# Altium schematic sheet STPMotorControl_1.SchDoc
size A4; SheetNumber: 2; SheetTotal: 8
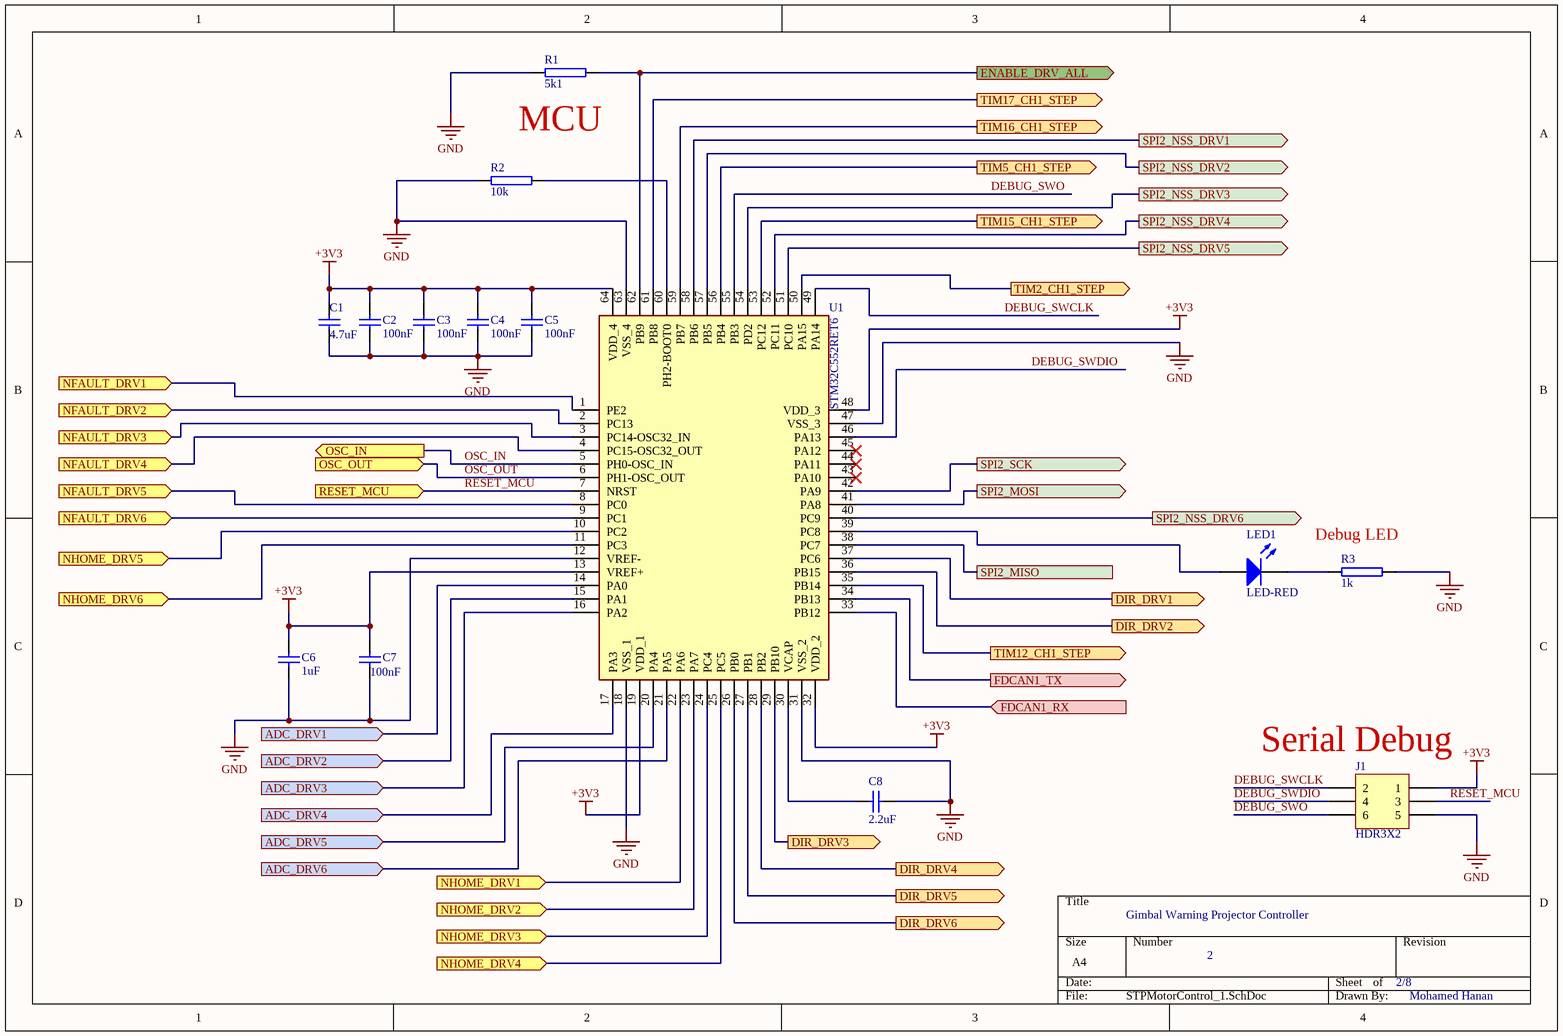
[diagram p0: STPMotorControl_1.SchDoc]

## Parts
C1  4.7uF  [CAP_1206]
C2  100nF  [CAP_0805]
C3  100nF  [CAP_0805]
C4  100nF  [CAP_0805]
C5  100nF  [CAP_0805]
C6  1uF  [CAP_0805]
C7  100nF  [CAP_0805]
C8  2.2uF  [CAP_0805]
J1  HDR3X2  [HDR2X3_AUT]
LED1  LED-RED  [LED1206R]
R1  5k1  [RES_0805]
R2  10k  [RES_0805]
R3  1k  [RES_1206]
U1  STM32C552RET6  [LQFP40P900X900X145-64N]

## Ports
ADC_DRV1 (in, see STPMotorConnections[2A], STPMotorControl7_1[2D]), ADC_DRV2 (in, see STPMotorConnections[2A], STPMotorControl7_1[2C]), ADC_DRV3 (in, see STPMotorConnections[2A], STPMotorControl7_1[2C]), ADC_DRV4 (in, see STPMotorConnections[2A], STPMotorControl7_1[2B]), ADC_DRV5 (in, see STPMotorConnections[2B], STPMotorControl7_1[2B]), ADC_DRV6 (in, see STPMotorConnections[2B], STPMotorControl7_1[2A]), DIR_DRV1 (out, see STPMotorConnections[2C], STPMotorControl4_1[2C]), DIR_DRV2 (out, see STPMotorConnections[2C], STPMotorControl4_1[4A]), DIR_DRV3 (out, see STPMotorConnections[2C], STPMotorControl5_1[2C]), DIR_DRV4 (out, see STPMotorConnections[2C], STPMotorControl5_1[4A]), DIR_DRV5 (out, see STPMotorConnections[2C], STPMotorControl6_1[2C]), DIR_DRV6 (out, see STPMotorConnections[2C], STPMotorControl6_1[4A]), ENABLE_DRV_ALL (out, see STPMotorConnections[3B]), FDCAN1_RX (in, see STPMotorConnections[3B], STPMotorControl2_1[1B]), FDCAN1_TX (out, see STPMotorConnections[3B], STPMotorControl2_1[1B]), NFAULT_DRV1 (in, see STPMotorConnections[2C], STPMotorControl4_1[2D]), NFAULT_DRV2 (in, see STPMotorConnections[2C], STPMotorControl4_1[4B]), NFAULT_DRV3 (in, see STPMotorConnections[2C], STPMotorControl5_1[2D]), NFAULT_DRV4 (in, see STPMotorConnections[2C], STPMotorControl5_1[4B]), NFAULT_DRV5 (in, see STPMotorConnections[2C], STPMotorControl6_1[2D]), NFAULT_DRV6 (in, see STPMotorConnections[2C], STPMotorControl6_1[4B]), NHOME_DRV1 (in, see STPMotorConnections[3A], STPMotorControl4_1[2C]), NHOME_DRV2 (in, see STPMotorConnections[3A], STPMotorControl4_1[4B]), NHOME_DRV3 (in, see STPMotorConnections[3A], STPMotorControl5_1[2C]), NHOME_DRV4 (in, see STPMotorConnections[3A], STPMotorControl5_1[4B]), NHOME_DRV5 (in, see STPMotorConnections[3B], STPMotorControl6_1[2C]), NHOME_DRV6 (in, see STPMotorConnections[3B], STPMotorControl6_1[4B]), OSC_IN (out, see STPMotorConnections[3C], STPMotorControl3_1[2C]), OSC_OUT (in, see STPMotorConnections[3C], STPMotorControl3_1[2C]), RESET_MCU (in, see STPMotorConnections[3C], STPMotorControl3_1[3C]), SPI2_MISO (see STPMotorConnections[3B], STPMotorControl4_1[4C], STPMotorControl5_1[4C], STPMotorControl6_1[4C]), SPI2_MOSI (out, see STPMotorConnections[3C], STPMotorControl4_1[4C], STPMotorControl5_1[4C], STPMotorControl6_1[4C]), SPI2_NSS_DRV1 (out, see STPMotorConnections[2B], STPMotorControl4_1[2C]), SPI2_NSS_DRV2 (out, see STPMotorConnections[2B], STPMotorControl4_1[4B]), SPI2_NSS_DRV3 (out, see STPMotorConnections[2B], STPMotorControl5_1[2C]), SPI2_NSS_DRV4 (out, see STPMotorConnections[2B], STPMotorControl5_1[4B]), SPI2_NSS_DRV5 (out, see STPMotorConnections[2B], STPMotorControl6_1[2C]), SPI2_NSS_DRV6 (out, see STPMotorConnections[2B], STPMotorControl6_1[4B]), SPI2_SCK (out, see STPMotorConnections[3B], STPMotorControl4_1[4C], STPMotorControl5_1[4C], STPMotorControl6_1[4C]), TIM2_CH1_STEP (out, see STPMotorConnections[2B], STPMotorControl4_1[3C]), TIM5_CH1_STEP (out, see STPMotorConnections[2B], STPMotorControl4_1[4A]), TIM12_CH1_STEP (out, see STPMotorConnections[2B], STPMotorControl5_1[2C]), TIM15_CH1_STEP (out, see STPMotorConnections[2B], STPMotorControl5_1[4A]), TIM16_CH1_STEP (out, see STPMotorConnections[2B], STPMotorControl6_1[2C]), TIM17_CH1_STEP (out, see STPMotorConnections[2B], STPMotorControl6_1[4A])

## Nets
+3V3: C1.2 C2.2 C3.2 C4.2 C5.2 C6.2 C7.2 J1.1 U1.13(VREF+) U1.19(VDD_1) U1.32(VDD_2) U1.48(VDD_3) U1.64(VDD_4)
GND: C1.1 C2.1 C3.1 C4.1 C5.1 C6.1 C7.1 C8.2 J1.5 R1.1 R2.1 R3.2 U1.12(VREF-) U1.18(VSS_1) U1.31(VSS_2) U1.47(VSS_3) U1.63(VSS_4)
ADC_DRV1: U1.14(PA0) ; port ADC_DRV1
ADC_DRV2: U1.15(PA1) ; port ADC_DRV2
ADC_DRV3: U1.16(PA2) ; port ADC_DRV3
ADC_DRV4: U1.17(PA3) ; port ADC_DRV4
ADC_DRV5: U1.20(PA4) ; port ADC_DRV5
ADC_DRV6: U1.21(PA5) ; port ADC_DRV6
DEBUG_SWCLK: J1.2 U1.49(PA14)
DEBUG_SWDIO: J1.4 U1.46(PA13)
DEBUG_SWO: J1.6 U1.55(PB3)
DIR_DRV1: U1.37(PC6) ; port DIR_DRV1
DIR_DRV2: U1.36(PB15) ; port DIR_DRV2
DIR_DRV3: U1.29(PB10) ; port DIR_DRV3
DIR_DRV4: U1.28(PB2) ; port DIR_DRV4
DIR_DRV5: U1.27(PB1) ; port DIR_DRV5
DIR_DRV6: U1.26(PB0) ; port DIR_DRV6
ENABLE_DRV_ALL: R1.2 U1.62(PB9) ; port ENABLE_DRV_ALL
FDCAN1_RX: U1.33(PB12) ; port FDCAN1_RX
FDCAN1_TX: U1.34(PB13) ; port FDCAN1_TX
NFAULT_DRV1: U1.1(PE2) ; port NFAULT_DRV1
NFAULT_DRV2: U1.2(PC13) ; port NFAULT_DRV2
NFAULT_DRV3: U1.3(PC14-OSC32_IN) ; port NFAULT_DRV3
NFAULT_DRV4: U1.4(PC15-OSC32_OUT) ; port NFAULT_DRV4
NFAULT_DRV5: U1.8(PC0) ; port NFAULT_DRV5
NFAULT_DRV6: U1.9(PC1) ; port NFAULT_DRV6
NHOME_DRV1: U1.22(PA6) ; port NHOME_DRV1
NHOME_DRV2: U1.23(PA7) ; port NHOME_DRV2
NHOME_DRV3: U1.24(PC4) ; port NHOME_DRV3
NHOME_DRV4: U1.25(PC5) ; port NHOME_DRV4
NHOME_DRV5: U1.10(PC2) ; port NHOME_DRV5
NHOME_DRV6: U1.11(PC3) ; port NHOME_DRV6
OSC_IN: U1.5(PH0-OSC_IN) ; port OSC_IN
OSC_OUT: U1.6(PH1-OSC_OUT) ; port OSC_OUT
RESET_MCU: J1.3 U1.7(NRST) ; port RESET_MCU
SPI2_MISO: U1.38(PC7) ; port SPI2_MISO
SPI2_MOSI: U1.41(PA8) ; port SPI2_MOSI
SPI2_NSS_DRV1: U1.58(PB6) ; port SPI2_NSS_DRV1
SPI2_NSS_DRV2: U1.57(PB5) ; port SPI2_NSS_DRV2
SPI2_NSS_DRV3: U1.54(PD2) ; port SPI2_NSS_DRV3
SPI2_NSS_DRV4: U1.52(PC11) ; port SPI2_NSS_DRV4
SPI2_NSS_DRV5: U1.51(PC10) ; port SPI2_NSS_DRV5
SPI2_NSS_DRV6: U1.40(PC9) ; port SPI2_NSS_DRV6
SPI2_SCK: U1.42(PA9) ; port SPI2_SCK
TIM2_CH1_STEP: U1.50(PA15) ; port TIM2_CH1_STEP
TIM5_CH1_STEP: U1.56(PB4) ; port TIM5_CH1_STEP
TIM12_CH1_STEP: U1.35(PB14) ; port TIM12_CH1_STEP
TIM15_CH1_STEP: U1.53(PC12) ; port TIM15_CH1_STEP
TIM16_CH1_STEP: U1.59(PB7) ; port TIM16_CH1_STEP
TIM17_CH1_STEP: U1.61(PB8) ; port TIM17_CH1_STEP
NetC8_1: C8.1 U1.30(VCAP)
NetLED1_A: LED1.A U1.39(PC8)
NetLED1_K: LED1.K R3.1
NetR2_2: R2.2 U1.60(PH2-BOOT0)

Not connected (* = marked no-connect by the designer): U1 43(PA10)* 44(PA11)* 45(PA12)*

## Notes on the sheet
- MCU
- (near R3) Debug LED
- (near J1) Serial Debug
- Gimbal Warning Projector Controller
- 2
- 2/8
- Mohamed Hanan

## Library data of the parts
C1 = CAPN 1206: Non Polarized Capacitor, SMD, 1206
C2-C8 = CAPN 0805: Non Polarized Capacitor, SMD, 0805
J1 = HDR3X2: Header, 3-Pin, Dual row, 2.54mm Pitch, Straight; Supplier 1: Farnell; Supplier Part Number 1: 9733574
LED1 = SMD 1206 LED-RED: RED LED, Case 1206; Supplier 1: Farnell; Supplier Part Number 1: 8530017
R1 R2 = Resistor 0805: Resistor, SMD, 0805
R3 = Resistor 1206: Resistor, SMD, 1206
U1 = STM32C552RET6: Integrated Circuit; Manufacturer_Name: STMicroelectronics; Datasheet Link: https://www.st.com/resource/en/datasheet/stm32c551cc.pdf; Height: 1.6mm; Manufacturer_Part_Number: STM32C552RET6